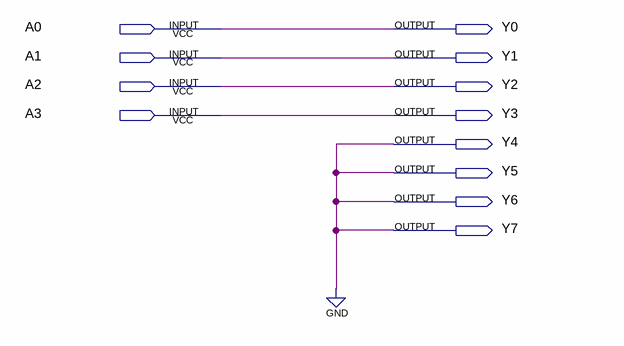
[diagram p0: schematic sheet]
// Quartus schematic Sign_Extend_8bit.bdf as structural Verilog: 0 symbols, 12 pins
module Sign_Extend_8bit (
  input  A0,
  input  A1,
  input  A2,
  input  A3,
  output Y0,
  output Y1,
  output Y2,
  output Y3,
  output Y4,
  output Y5,
  output Y6,
  output Y7
);


  assign Y0 = A0;
  assign Y1 = A1;
  assign Y2 = A2;
  assign Y3 = A3;
  assign Y4 = 1'b0;
  assign Y5 = 1'b0;
  assign Y6 = 1'b0;
  assign Y7 = 1'b0;
endmodule
